# Altium schematic sheet Power.SchDoc
size A4; SheetNumber: 4; SheetTotal: 8
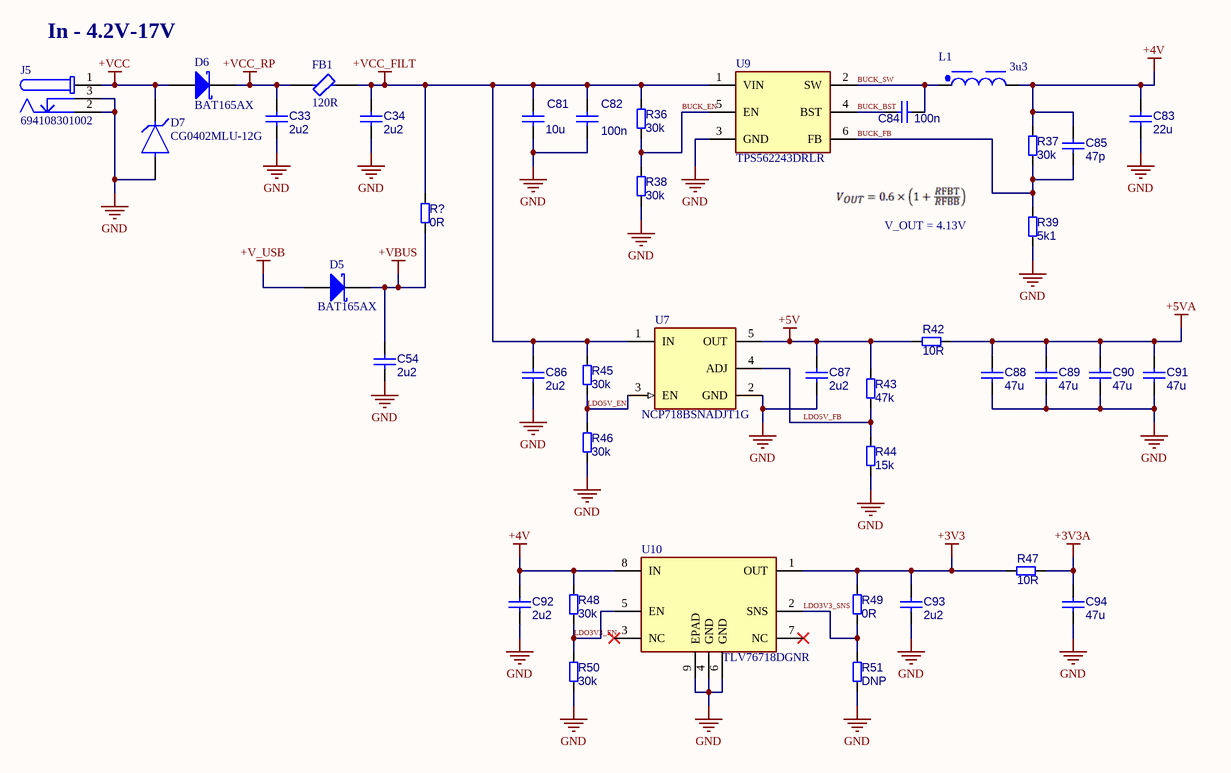
[diagram p0: Power.SchDoc]

## Parts
C33  2u2  [C_0402]
C34  2u2  [C_0402]
C54  2u2  [C_0402]
C81  10u  [C_0805]
C82  100n  [CAPC1005X50N_0402]
C83  22u  [C_0805]
C84  100n  [CAPC1005X50N_0402]
C85  47p  [C_0805]
C86  2u2  [C_0402]
C87  2u2  [C_0402]
C88  47u  [C_1210]
C89  47u  [C_1210]
C90  47u  [C_1210]
C91  47u  [C_1210]
C92  2u2  [C_0402]
C93  2u2  [C_0402]
C94  47u  [C_1210]
D5  BAT165AX  [JCET-SMB-2_M]
D6  BAT165AX  [JCET-SMB-2_M]
D7  CG0402MLU-12G  [FP-1610-MFG]
FB1  120R  [FP-NFZ32BW-w2_8-MFG]
J5  694108301002  [694108301002]
L1  3u3  [WE-XHMI_4030]
R36  30k  [R_0603]
R37  30k  [R_0603]
R38  30k  [R_0603]
R39  5k1  [R_0603]
R42  10R  [R_0603]
R43  47k  [R_0603]
R44  15k  [R_0603]
R45  30k  [R_0603]
R46  30k  [R_0603]
R47  10R  [R_0603]
R48  30k  [R_0603]
R49  0R  [R_0603]
R50  30k  [R_0603]
R51  DNP  [R_0603]
R?  0R  [R_0603]
U7  NCP718BSNADJT1G  [FP-419AE-01-IPC_C]
U9  TPS562243DRLR  [SOT-563-6_TPS56224]
U10  TLV76718DGNR  [HVSSOP-8-PowerPAD_TLV767]

## Nets
+3V3: C93.1 R47.1 R49.2 U10.1(OUT)
+3V3A: C94.2 R47.2
+4V: C83.1 C85.1 C92.1 L1.2 R37.1 R48.1 U10.8(IN)
+5V: C87.1 R42.1 R43.1 U7.5(OUT)
+5VA: C88.2 C89.2 C90.2 C91.2 R42.2
+V_USB: D5.1(A)
+VBUS: C54.1 D5.2(K) R?.2
+VCC: D6.1(A) D7.1(C) J5.1
+VCC_FILT: C34.1 C81.2 C82.1 C86.1 FB1.2 R36.1 R45.1 R?.1 U7.1(IN) U9.1(VIN)
+VCC_RP: C33.1 D6.2(K) FB1.1
GND: C33.2 C34.2 C54.2 C81.1 C82.2 C83.2 C86.2 C87.2 C88.1 C89.1 C90.1 C91.1 C92.2 C93.2 C94.1 D7.2(A) J5.2 J5.3 R38.2 R39.2 R44.2 R46.2 R50.2 R51.1 U7.2(GND) U9.3(GND) U10.4(GND) U10.6(GND) U10.9(EPAD)
BUCK_BST: C84.2 U9.4(BST)
BUCK_EN: R36.2 R38.1 U9.5(EN)
BUCK_FB: C85.2 R37.2 R39.1 U9.6(FB)
BUCK_SW: C84.1 L1.1 U9.2(SW)
LDO3V3_EN: R48.2 R50.1 U10.5(EN)
LDO3V3_SNS: R49.1 R51.2 U10.2(SNS)
LDO5V_EN: R45.2 R46.1 U7.3(EN)
LDO5V_FB: R43.2 R44.1 U7.4(ADJ)

Not connected (* = marked no-connect by the designer): U10 3(NC)* 7(NC)*

## Notes on the sheet
- In - 4.2V-17V
- V_OUT = 4.13V

## Library data of the parts
C33 C34 C54 C86 C87 C92 C93 = CMP-001-00085-2: Capacitor SMD Tantalum 0603 50V / Kyocera AVX F981C225MMA
C81 C83 C85 = CMP-001-00086-2: MLCC 0805
C82 C84 = CMP-001-00084-2: MLCC 0402 50V / Samsung CL05B104KB54PNC
C88-C91 C94 = CMP-001-00088-1: 1210, X5R:EIA, 100uF, DC6.3V, GRM32ER60J107ME20
D5 D6 = CMP-004-00006-2: Nexperia BAT165AX / Rectifier Diode, Schottky, 1 Phase, 1 Element, 0.5A, 40V V(RRM), Silicon; Manufacturer: JCET; Datasheet URL: http://wiki.seeedstudio.com/images/3/3f/0310130P1.pdf; Datasheet Version: May-13; Package Reference: SMB-2; RoHS Compliant: Unknown; Manufacturer URL: http://www.cj-elec.com/; Mounting Technology: SM; Package Description: 2-Pin Surface Mount Device, Body 4.315 x 3.62 mm; Case/Package: SMB-2
D7 = CMP-12225-000013-1: Bourns CG0402MLU-12G / ESD Protection Device, 25 V, 0402 [1005 Metric], 2 Pins, 12 V, 0.05 pF, ChipGuard MLU; Manufacturer: STMicroelectronics; Manufacturer Part Number: ESDA7P60-1U1M; Number Of Channels: 1; Standoff Height: 0mm; Breakdown Voltage: 6.4V; Direction: Unidirectional; Clamping Voltage: 10.2V; Peak Pulse Power: 700W; Peak Pulse Current: 60A; Reverse Standoff Voltage: 5V; Max Junction Temp: +150°C; ComponentLink2Description: Datasheet; Temperature Range Low: -55°C; Package: 1610; Lead Free: Yes; Temperature Range High: +150°C; Temperature: -55°C to +150°C; Device Class L2: TVS Diodes; Category: Diode; Device Class L1: Circuit Protection; Digikey Description: TVS DIODE 5V 11.6V 1610; ComponentLink2URL: http://www.st.com/content/ccc/resource/technical/document/datasheet/44/e9/26/44/42/ee/4f/e5/DM00139972.pdf/files/DM00139972.pdf/jcr:content/translations/en.DM00139972.pdf; RoHS: TRUE; Octopart: https://octopart.com/esda7p60-1u1m-stmicroelectronics-52112702; Height: 0.65mm; Device Class L3: unset; Automotive: No
FB1 = CMP-06046-002300-1: Ferrite Bead 3.6Ω @ 1MHz ±30% 2.55A 0.036Ω 1210 Embossed T/R
J5 = CMP-1502-00190-4: DC Power Jack Connector WR-DC, Male, Right Angled, THT, 5 A, 24 V; Operating Supply Voltage: 24V; Shielding: Unshielded; Voltage Rating: 30V; Number of Contacts: 3; Insulation Resistance: 100MΩ; Current Rating: 5A; Min Operating Temperature: -40°C; Packaging: Bulk; Connector Type: Power; Housing Material: Polyamide; REACH SVHC: Unknown; Termination: Through Hole; Contact Gender: Female; Mount: Through Hole; RoHS: Compliant; Flammability Rating: UL94 V-0; Height: 11mm; Max Operating Temperature: 85°C; Contact Plating: Tin; Color: Black; Gender: Male; Contact Material: Gold, Tin
L1 = CMP-03913-148605656-1: Power Inductor, 3.3UH, Shielded, 7.1A Rohs Compliant: Yes / Wurth 74439324033; ComponentLink1Description: Mauser; ComponentLink1URL: https://eu.mouser.com/en/ProductDetail/Wurth-Elektronik/74439324033?qs=HFfMDpzxxd18KH4wt4XmSg%3D%3D
R36-R39 R42-R51 R? = CMP-009-00177-7: Chip resistor 0603
U7 = CMP-07128-000004-1: 300 MA LOW IQ WIDE INPUT; Manufacturer: On Semiconductor; Max Supply Voltage: 24V; Output Type: AdjustableProgrammable; Min Supply Voltage: 2.5V; Max Junction Temp: +125°C; Nominal Supply Current: 50-300uA; Dropout Voltage: 480mV; Accuracy Percentage: 2%; Standoff Height: 0.01mm; Output Voltage: 1.2-5V; Number Of Outputs: 1; Output Current: 300mA; Lead Free: Yes; Temperature: to +125°C; ComponentLink2URL: https://www.onsemi.com/pub/Collateral/NCP718-D.PDF; Height: 1mm; ComponentLink2Description: Datasheet; Octopart: https://octopart.com/ncp718bsnadjt1g-on+semiconductor-87658781; Manufacturer Part Number: NCP718BSNADJT1G; Device Class L1: Integrated Circuits (ICs); Device Class L2: Power Management ICs; Device Class L3: Voltage Regulators - Linear; Digikey Description: 300 MA LOW IQ WIDE INPUT; Temperature Range High: +125°C; Package: 419AE-01; Mouser Description: LDO Regulator, 300 mA, Wide Vin, Ultra-Low Iq Adjustable, Non-Active Discharge, TSOT23-5; Category: IC; Automotive: No; RoHS: TRUE; ComponentLink3Description: Mauser; ComponentLink3URL: https://eu.mouser.com/en/ProductDetail/onsemi/NCP718BSNADJT1G?qs=MLItCLRbWszq%252BMkbDp%2FijQ%3D%3D
U9 = CMP-019-00067-2: 4.2V to 17V input voltage, 2A, 1.2MHz synchronous buck converter in SOT563 with Eco-mode 6-SOT-5X3 -40 to 125; Manufacturer Lifecycle Status: ACTIVE; Width: 1.2mm; Height: 600µm; Topology: Buck; RoHS: Compliant; Thickness: 550µm; Length: 1.6mm; Lifecycle Status: Production; Pins: 6
U10 = CMP-019-00068-2: Adjustable- and fixed-output, 1-A, 16-V, positive-voltage low-dropout (LDO) linear regulator; Manufacturer Lifecycle Status: ACTIVE; Output Voltage: 1.8V; Number of Channels: 1; Width: 3mm; Lifecycle Status: Production; Thickness: 1.02mm; Length: 3mm; Pins: 8; RoHS: Compliant; Height: 1.1mm